# Altium schematic sheet 00_System_Top.SchDoc: Diagrama de bloques
size A4; DrawnBy: Mateo Cárdenas; Revision: Rev A; SheetNumber: 1; SheetTotal: 7
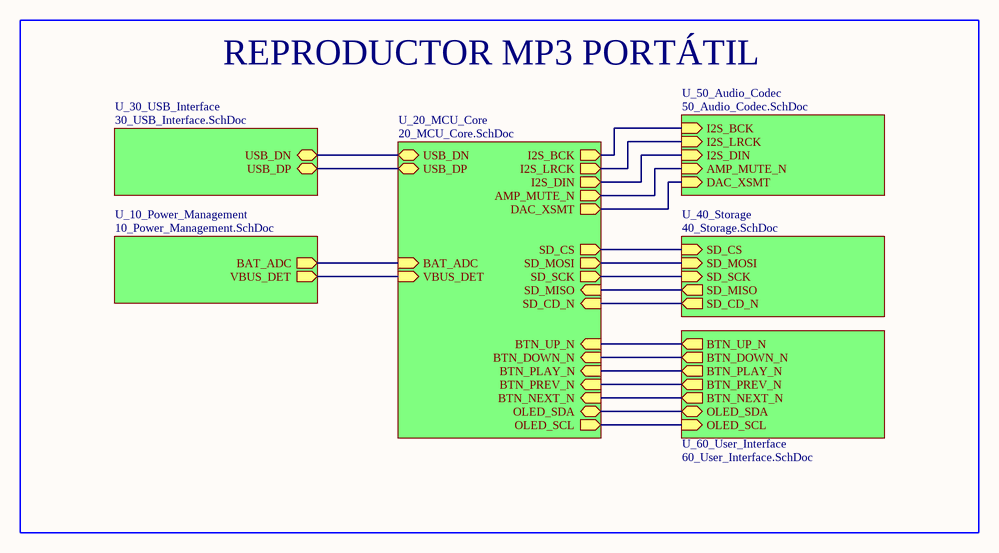
[diagram p0: 00_System_Top.SchDoc]

## Sub-sheets
U_10_Power_Management = 10_Power_Management.SchDoc: BAT_ADC (out), VBUS_DET (out)
U_20_MCU_Core = 20_MCU_Core.SchDoc: USB_DN (bidir), USB_DP (bidir), I2S_BCK (out), I2S_LRCK (out), I2S_DIN (out), AMP_MUTE_N (out), DAC_XSMT (out), SD_MOSI (out), SD_SCK (out), SD_MISO (in), SD_CD_N (in), SD_CS (out), OLED_SCL (out), OLED_SDA (bidir), BTN_NEXT_N (in), BTN_PREV_N (in), BTN_PLAY_N (in), BTN_DOWN_N (in), BTN_UP_N (in), VBUS_DET (in), BAT_ADC (in)
U_30_USB_Interface = 30_USB_Interface.SchDoc: USB_DN (bidir), USB_DP (bidir)
U_40_Storage = 40_Storage.SchDoc: SD_CS (in), SD_MOSI (in), SD_SCK (in), SD_MISO (out), SD_CD_N (out)
U_50_Audio_Codec = 50_Audio_Codec.SchDoc: I2S_BCK (in), I2S_LRCK (in), I2S_DIN (in), DAC_XSMT (in), AMP_MUTE_N (in)
U_60_User_Interface = 60_User_Interface.SchDoc: BTN_UP_N (out), BTN_DOWN_N (out), BTN_PLAY_N (out), BTN_PREV_N (out), BTN_NEXT_N (out), OLED_SDA (bidir), OLED_SCL (in)

## Nets
(unnamed): sheet U_10_Power_Management/BAT_ADC, sheet U_20_MCU_Core/BAT_ADC
(unnamed): sheet U_10_Power_Management/VBUS_DET, sheet U_20_MCU_Core/VBUS_DET
(unnamed): sheet U_60_User_Interface/BTN_UP_N, sheet U_20_MCU_Core/BTN_UP_N
(unnamed): sheet U_60_User_Interface/BTN_DOWN_N, sheet U_20_MCU_Core/BTN_DOWN_N
(unnamed): sheet U_60_User_Interface/BTN_PLAY_N, sheet U_20_MCU_Core/BTN_PLAY_N
(unnamed): sheet U_60_User_Interface/BTN_PREV_N, sheet U_20_MCU_Core/BTN_PREV_N
(unnamed): sheet U_60_User_Interface/BTN_NEXT_N, sheet U_20_MCU_Core/BTN_NEXT_N
(unnamed): sheet U_60_User_Interface/OLED_SDA, sheet U_20_MCU_Core/OLED_SDA
(unnamed): sheet U_60_User_Interface/OLED_SCL, sheet U_20_MCU_Core/OLED_SCL
(unnamed): sheet U_20_MCU_Core/USB_DN, sheet U_30_USB_Interface/USB_DN
(unnamed): sheet U_20_MCU_Core/USB_DP, sheet U_30_USB_Interface/USB_DP
(unnamed): sheet U_20_MCU_Core/I2S_BCK, sheet U_50_Audio_Codec/I2S_BCK
(unnamed): sheet U_20_MCU_Core/I2S_LRCK, sheet U_50_Audio_Codec/I2S_LRCK
(unnamed): sheet U_20_MCU_Core/I2S_DIN, sheet U_50_Audio_Codec/I2S_DIN
(unnamed): sheet U_20_MCU_Core/AMP_MUTE_N, sheet U_50_Audio_Codec/AMP_MUTE_N
(unnamed): sheet U_20_MCU_Core/DAC_XSMT, sheet U_50_Audio_Codec/DAC_XSMT
(unnamed): sheet U_20_MCU_Core/SD_MOSI, sheet U_40_Storage/SD_MOSI
(unnamed): sheet U_20_MCU_Core/SD_SCK, sheet U_40_Storage/SD_SCK
(unnamed): sheet U_20_MCU_Core/SD_MISO, sheet U_40_Storage/SD_MISO
(unnamed): sheet U_20_MCU_Core/SD_CD_N, sheet U_40_Storage/SD_CD_N
(unnamed): sheet U_20_MCU_Core/SD_CS, sheet U_40_Storage/SD_CS

## Notes on the sheet
- REPRODUCTOR MP3 PORTÁTIL